# Altium schematic sheet Touch_Sensor_Section.SchDoc
size A4
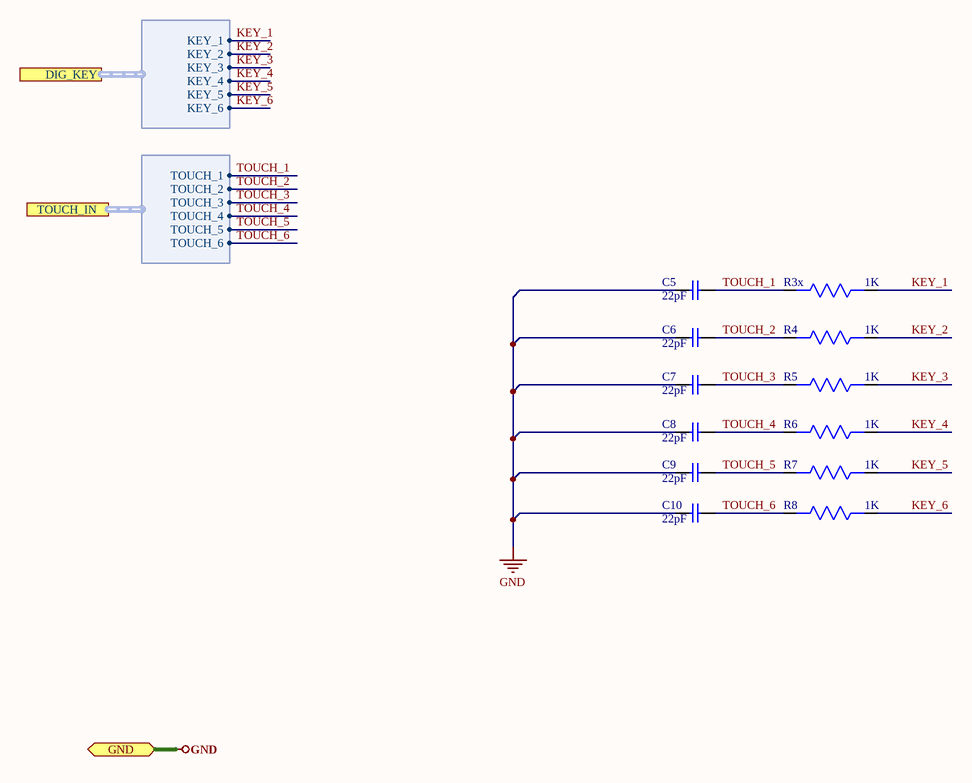
[diagram p0: Touch_Sensor_Section.SchDoc]

## Parts
C5  22pF  [Cap0805]
C6  22pF  [Cap0805]
C7  22pF  [Cap0805]
C8  22pF  [Cap0805]
C9  22pF  [Cap0805]
C10  22pF  [Cap0805]
R3x  1K  [RES 0805]
R4  1K  [RES 0805]
R5  1K  [RES 0805]
R6  1K  [RES 0805]
R7  1K  [RES 0805]
R8  1K  [RES 0805]

## Ports
DIG_KEY (harness Cap_Harness), GND (bidir), TOUCH_IN (harness Touch_Harness)

## Harnesses
Cap_Harness: KEY_1, KEY_2, KEY_3, KEY_4, KEY_5, KEY_6
Touch_Harness: TOUCH_1, TOUCH_2, TOUCH_3, TOUCH_4, TOUCH_5, TOUCH_6

## Nets
GND: C5.1 C6.1 C7.1 C8.1 C9.1 C10.1 ; port GND
KEY_1: R3x.1 ; port DIG_KEY.KEY_1
KEY_2: R4.1 ; port DIG_KEY.KEY_2
KEY_3: R5.1 ; port DIG_KEY.KEY_3
KEY_4: R6.1 ; port DIG_KEY.KEY_4
KEY_5: R7.1 ; port DIG_KEY.KEY_5
KEY_6: R8.1 ; port DIG_KEY.KEY_6
TOUCH_1: C5.2 R3x.2 ; port TOUCH_IN.TOUCH_1
TOUCH_2: C6.2 R4.2 ; port TOUCH_IN.TOUCH_2
TOUCH_3: C7.2 R5.2 ; port TOUCH_IN.TOUCH_3
TOUCH_4: C8.2 R6.2 ; port TOUCH_IN.TOUCH_4
TOUCH_5: C9.2 R7.2 ; port TOUCH_IN.TOUCH_5
TOUCH_6: C10.2 R8.2 ; port TOUCH_IN.TOUCH_6

## Library data of the parts
C5-C10 = AC0805JRNPO9BN220: CAP CER 22PF 50V NPO 0805; Manufacturer: Yageo; Supplier 1: Digi-Key; Manufacturer Part Number: AC0805JRNPO9BN220; RoHS: Yes; Category: Ceramic Capacitors; Stock 1: 633; Pricing 1: 1=0.18000, 10=0.12900, 50=0.07320, 100=0.06060, 500=0.04250, 1000=0.03519 (USD); RoHS Compliant: Yes; Supplier Part Number 1: 311-3136-1-ND
R3x R4-R8 = CRCW08051K00JNEB: RES SMD 1K OHM 5% 1/8W 0805; Manufacturer: Vishay Dale; Resistance: 1kR; Power Rating: 125mW; Voltage Rating: 150V; Temperature Coefficient: 200ppm/°C; Supplier 1: Digi-Key; Manufacturer Part Number: CRCW08051K00JNEB; RoHS: Yes; Category: Chip SMD Resistors; Stock 1: 4389; Pricing 1: 1=0.10000, 10=0.05000, 100=0.02040, 1000=0.00914, 2500=0.00794, 5000=0.00656 (USD); Case/Package: 0805; Number of Pins: 2; Weight: 0.000194oz; Case Code (Imperial): 0805; Case Code (Metric): 2012; Contact Plating: Tin; Min Operating Temperature: -55°C; Max Operating Temperature: 155°C; Packaging: Tape and Reel; Tolerance: 5%; Package Quantity: 10000; Resistor Type: Thick Film; Number of Terminations: 2; Termination: SMD/SMT; Max Power Dissipation: 125mW; Voltage Rating (DC): 150V; Features: Automotive AEC-Q200; Length: 0.079inch; Width: 0.049inch; Height: 0.02inch; Radiation Hardening: No; REACH SVHC: Unknown; Lead Free: Lead Free; ComponentLink1URL: https://datasheet.ciiva.com/5548/dcrcwe3-109170-5548326.pdf?src-supplier=Mouser; ComponentLink1Description: https://datasheet.ciiva.com/5548/dcrcwe3-109170-5548326.pdf?src-supplier=Mouser; ComponentLink2URL: https://datasheet.ciiva.com/28621/1747939-28621434.pdf?src-supplier=Element14; ComponentLink2Description: https://datasheet.ciiva.com/28621/1747939-28621434.pdf?src-supplier=Element14; Supplier Part Number 1: 541-CRCW08051K00JNEBCT-ND